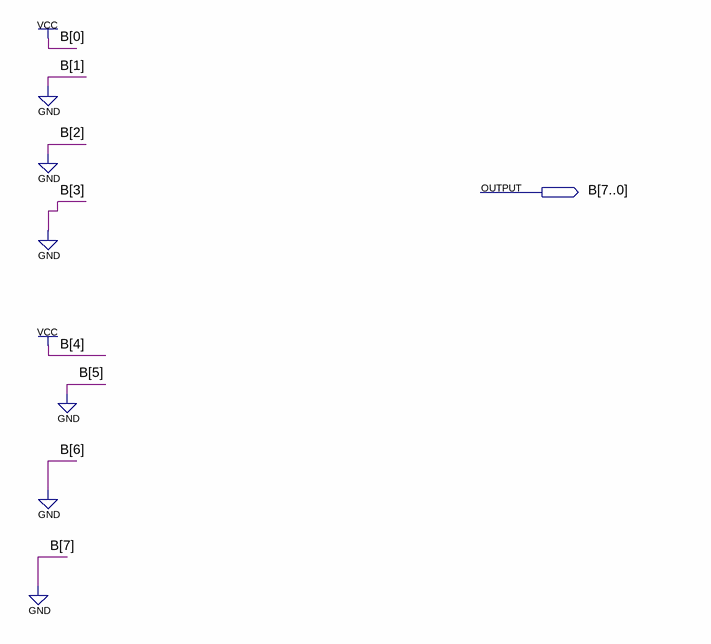
[diagram p0: schematic sheet]
// Quartus schematic D.bdf as structural Verilog: 0 symbols, 1 pins
module D (
  output [7:0] B
);


  assign B = 8'b00010001;
endmodule
